# Altium project MONO65_DB_A1_Project.PrjPcb
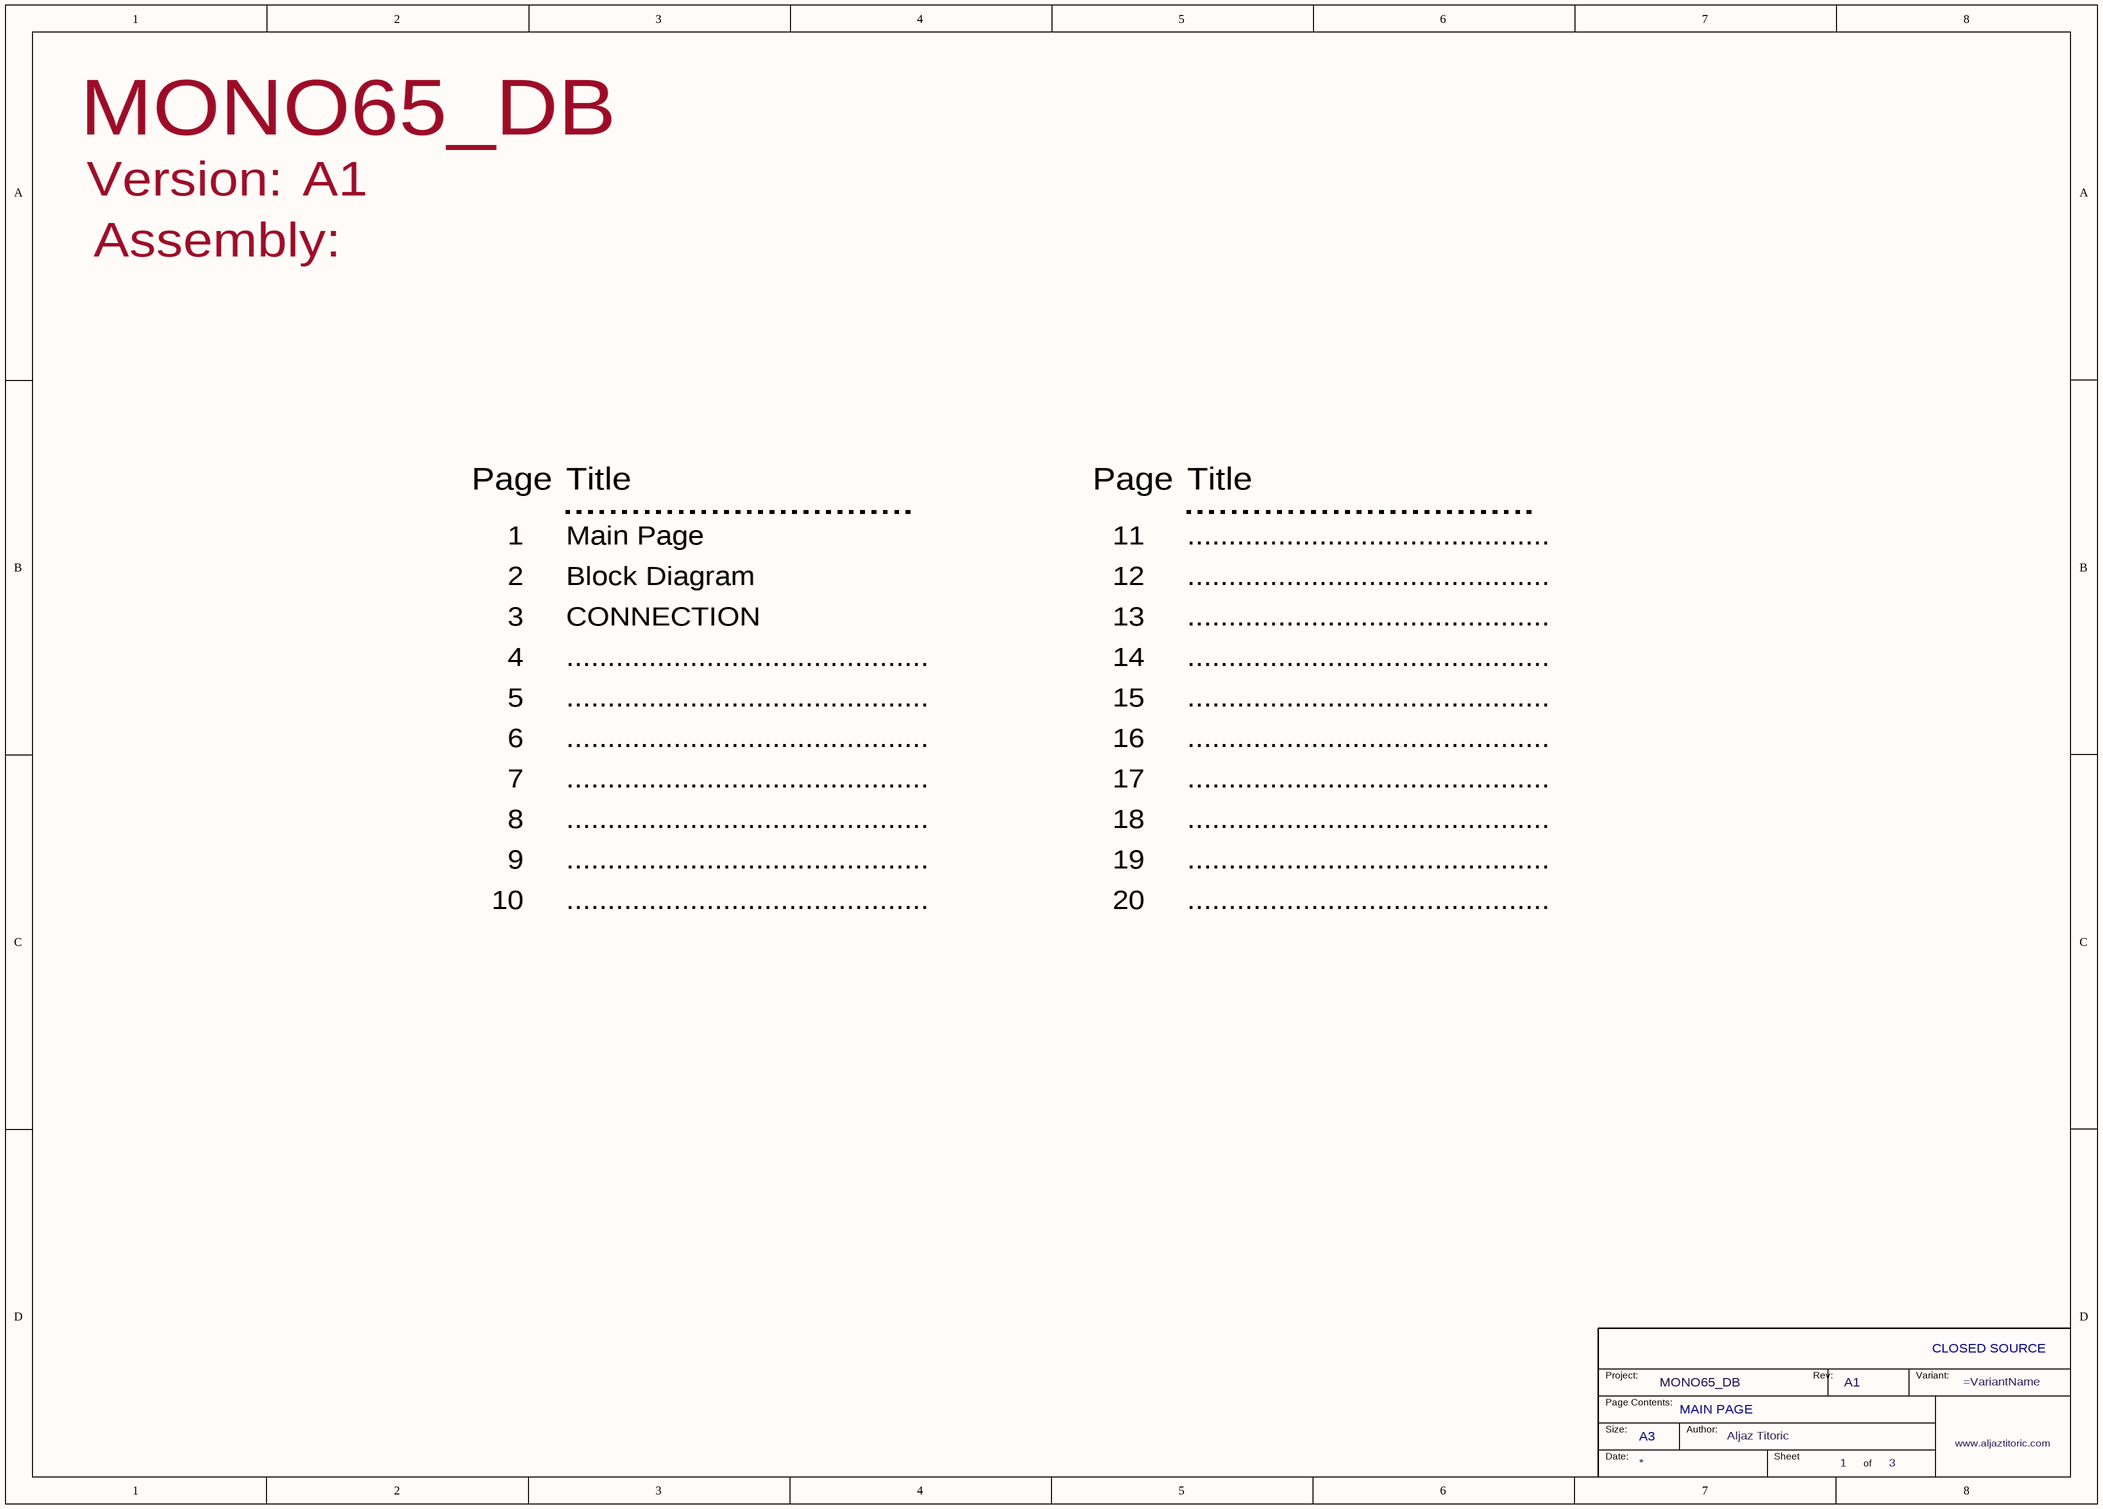
[diagram p0: MONO65_DB_A1_s01 [Main page].SchDoc]
DesignedBy: Aljaz Titoric; DesignedByURL: www.aljaztitoric.com; Project: MONO65_DB; VersionRevision: A1
3 sheets, 15 parts. Net scope: global (net labels, ports and power ports of the same name join across sheets).
Board file: MONO65_DB_A1.PcbDoc
Sheets:
  MONO65_DB_A1_s01 [Main page].SchDoc
  MONO65_DB_A1_s02 [Block diagram].SchDoc
  MONO65_DB_A1_s03 [Connection].SchDoc

## Sheet MONO65_DB_A1_s01 [Main page].SchDoc
size A3; DocumentNumber: 1; SheetNumber: 1; SheetTotal: 3

### Parts
TB*  PageContents: MAIN PAGE  Licence: CLOSED SOURCE  Size: A3  (hidden comment: TBL TitleBlock 01)  (graphical)

### Notes on the sheet
- Version:
- Assembly:
- Page
- Title
- 1
- 2
- Main Page
- Block Diagram
- 11
- 12
- ............................................
- 3
- CONNECTION
- 13
- 4
- 5
- 14
- 15
- 6
- 16
- 7
- 8
- 17
- 18
- 9
- 10
- 19
- 20
- (in symbol TBL TitleBlock 01) Project:; Rev:; Variant:; Page Contents:; Size:; Author:; Date:; Sheet; of

### Library data of the parts
TB* = TBL TitleBlock 01: Custom Title block

## Sheet MONO65_DB_A1_s02 [Block diagram].SchDoc
size A3; DocumentNumber: 2; SheetNumber: 2; SheetTotal: 3
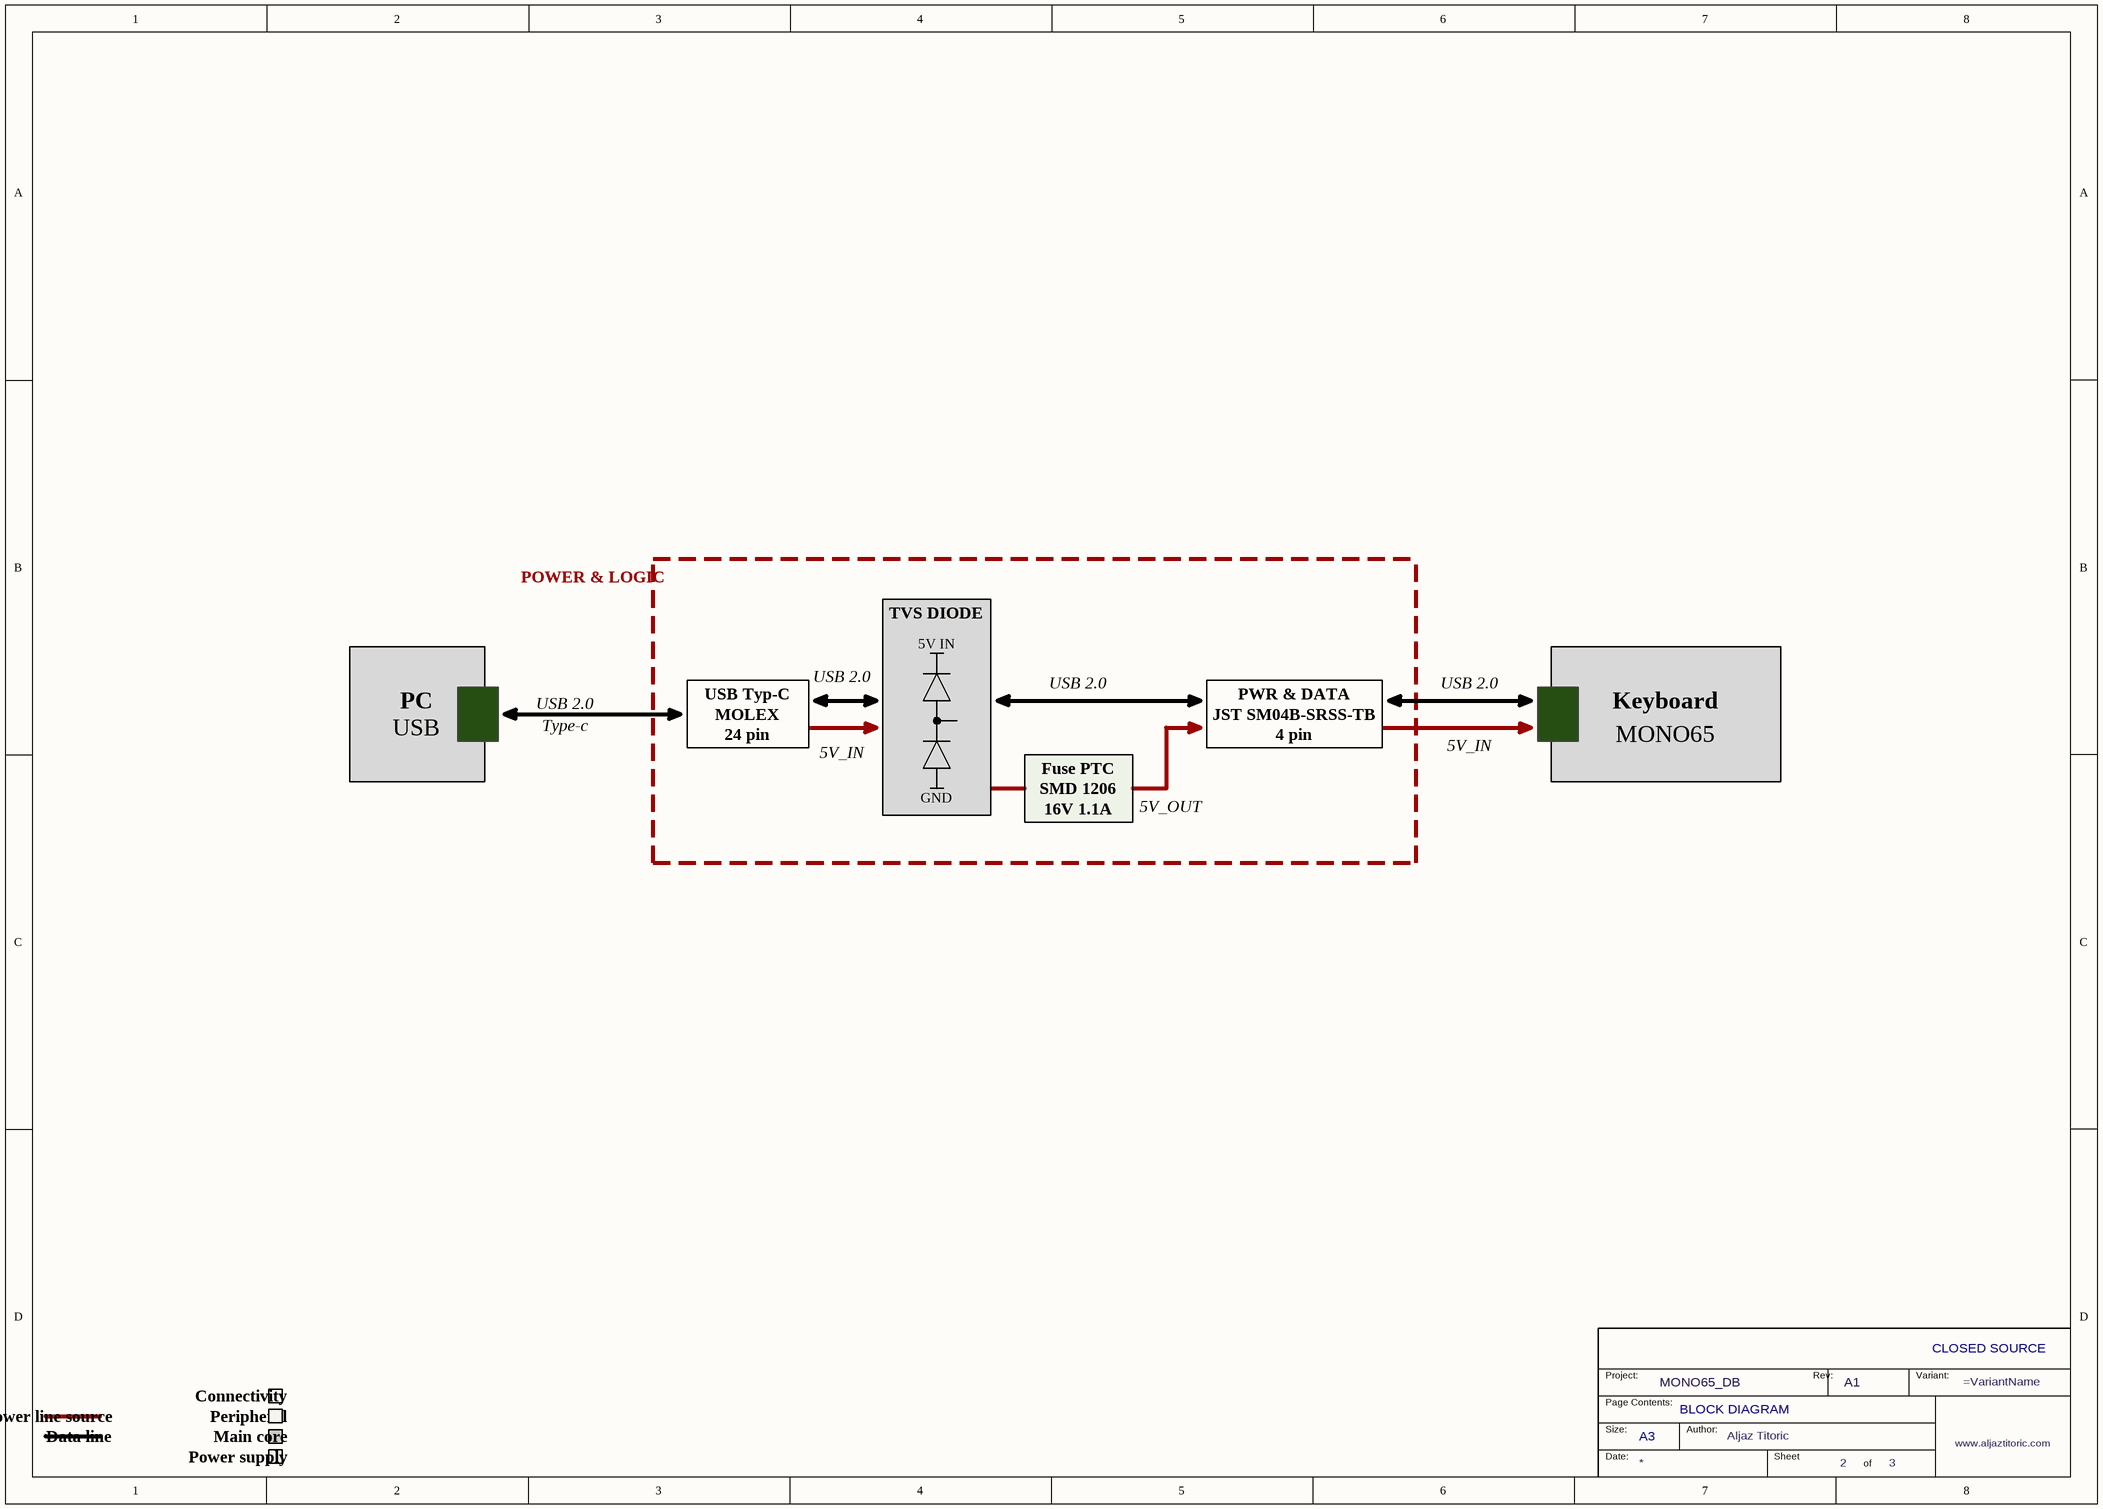
[diagram p1: MONO65_DB_A1_s02 [Block diagram].SchDoc]

### Parts
(Parts that share a designator on the sheet are numbered #1, #2 ... from top to bottom, then left to right.)
TB*?#1  PageContents: BLOCK DIAGRAM  Licence: CLOSED SOURCE  Size: A3  (hidden comment: TBL TitleBlock 01)  (graphical)

### Notes on the sheet
- POWER & LOGIC
- TVS DIODE
- 5V IN
- PC
- USB
- USB 2.0
- Type-c
- MOLEX
- USB Typ-C
- JST SM04B-SRSS-TB
- PWR & DATA
- Keyboard
- 24 pin
- 5V_IN
- GND
- Fuse PTC
- SMD 1206
- 4 pin
- MONO65
- 16V 1.1A
- 5V_OUT
- Connectivity
- Data line
- Power line source
- Peripheral
- Main core
- Power supply
- (in symbol TBL TitleBlock 01) Project:; Rev:; Variant:; Page Contents:; Size:; Author:; Date:; Sheet; of

### Library data of the parts
TB*?#1 = TBL TitleBlock 01: Custom Title block

## Sheet MONO65_DB_A1_s03 [Connection].SchDoc
size A3; DocumentNumber: 3; SheetNumber: 3; SheetTotal: 3
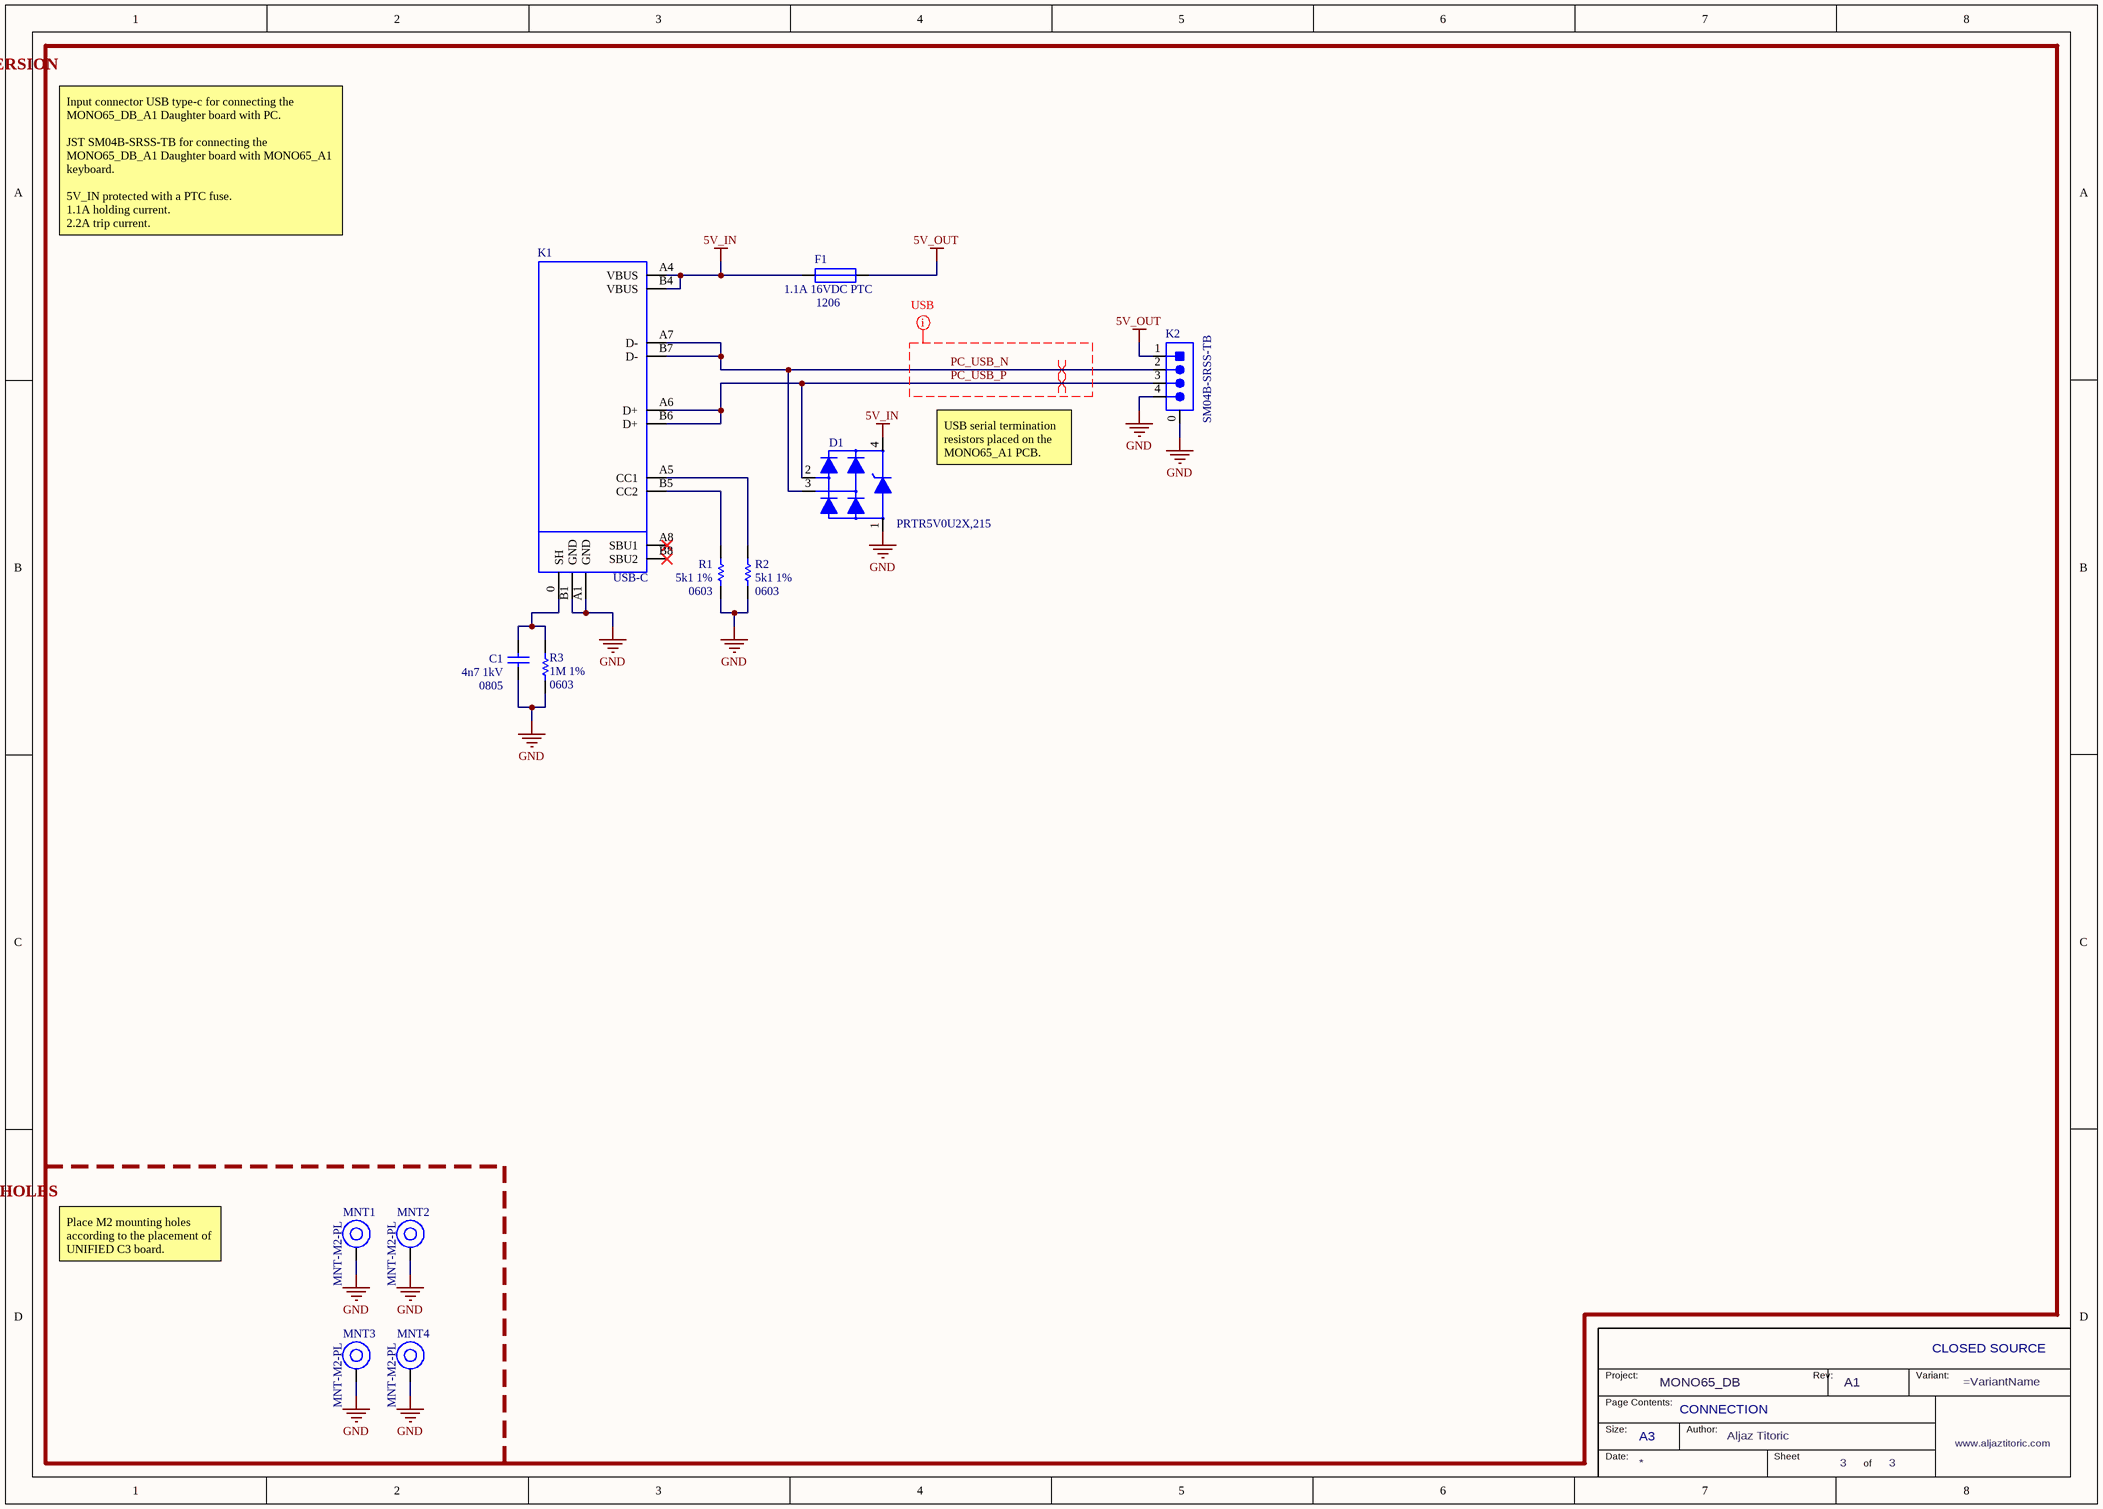
[diagram p2: MONO65_DB_A1_s03 [Connection].SchDoc]

### Parts
(Parts that share a designator on the sheet are numbered #1, #2 ... from top to bottom, then left to right.)
C1  4n7 1kV  Case/Package: 0805  [CAPC2012X12N]
D1  PRTR5V0U2X,215  [SOT143B290X130-4N]
F1  1.1A 16VDC PTC  Case/Package: 1206  [PTC3116X06N]
K1  USB-C  [USB-TYP-C-2.0-217179-0001]
K2  SM04B-SRSS-TB  [SM04B-SRSS-TB]
MNT1  MNT-M2-PL  [MNT-M2-PL]  (no BOM)
MNT2  MNT-M2-PL  [MNT-M2-PL]  (no BOM)
MNT3  MNT-M2-PL  [MNT-M2-PL]  (no BOM)
MNT4  MNT-M2-PL  [MNT-M2-PL]  (no BOM)
R1  5k1 1%  Case/Package: 0603  [RESC1608X04N]
R2  5k1 1%  Case/Package: 0603  [RESC1608X04N]
R3  1M 1%  Case/Package: 0603  [RESC1608X04N]
TB*?#2  PageContents: CONNECTION  Licence: CLOSED SOURCE  Size: A3  (hidden comment: TBL TitleBlock 01)  (graphical)

### Nets
5V_IN: D1.4(VCC) F1.1 K1.A4(VBUS) K1.B4(VBUS)
5V_OUT: F1.2 K2.1
GND: C1.2 D1.1(GND) K1.A1(GND) K1.B1(GND) K2.0 K2.4 MNT1.1 MNT2.1 MNT3.1 MNT4.1 R1.2 R2.2 R3.2
PC_USB_N: D1.3(I/O_2) K1.A7(D-) K1.B7(D-) K2.2
PC_USB_P: D1.2(I/O_1) K1.A6(D+) K1.B6(D+) K2.3
NetC1_1: C1.1 K1.0(SH) R3.1
NetK1_A5: K1.A5(CC1) R2.1
NetK1_B5: K1.B5(CC2) R1.1

Not connected (* = marked no-connect by the designer): K1 A8(SBU1)* B8(SBU2)*

### Layout directives
differential pair; differential pair class DIFF_90Ohm_USB: PC_USB_N, PC_USB_P
net class USB: PC_USB_N, PC_USB_P

### Notes on the sheet
- USB TO JST CONVERSION
- Input connector USB type-c for connecting the MONO65_DB_A1 Daughter board with PC.
  JST SM04B-SRSS-TB for connecting the MONO65_DB_A1 Daughter board with MONO65_A1 keyboard.
  5V_IN protected with a PTC fuse.
  1.1A holding current.
  2.2A trip current.
- USB serial termination resistors placed on the MONO65_A1 PCB.
- M2 MOUNTING HOLES
- Place M2 mounting holes according to the placement of UNIFIED C3 board.
- (in symbol TBL TitleBlock 01) Project:; Rev:; Variant:; Page Contents:; Size:; Author:; Date:; Sheet; of

### Library data of the parts
C1 = CAP SMD CER 4.7n 1kV X7R 0805: SMD CAPACITOR, 4.7n, 1kV, X7R, 0805; Manufacturer: KEMET; Manufacturer Part Number: C0805C472KDRACTU; Dielectric Material: Ceramic; Voltage Rating (DC): 1.5kV; Tolerance: 10%; Capacitance: 4.7nF; Supplier 1: Farnell; Stock 1: 5000; Pricing 1: 2500 = 0,05000 (EUR); RoHS: Yes; Mount: Surface Mount; Case Code (Imperial): 0805; Case Code (Metric): 2012; Min Operating Temperature: -55°C; Max Operating Temperature: 125°C; Package Quantity: 1; Voltage Rating: 1kV; Packaging: Tape and Reel; Dielectric: X7R; Termination: SMD/SMT; Series: C; Length: 2mm; Width: 1.2mm; Height: 1.25mm; Thickness: 0.055inch; Depth: 1.25mm; RoHS Compliant: Yes; ComponentLink1URL: https://datasheet.ciiva.com/5409/kem-c1010-x7r-hv-smd-5409114.pdf?src-supplier=Mouser; ComponentLink1Description: https://datasheet.ciiva.com/5409/kem-c1010-x7r-hv-smd-5409114.pdf?src-supplier=Mouser; Supplier Part Number 1: 3299100
D1 = SEM TVS 5.5V DUAL SOT143B PRTR5V0U2X,215: TVS ESD DIODE - PRTR5V0U2X - Ultra low capacitance double rail-to-rail ESD protection diode; Manufacturer: Nexperia; Supplier 1: Digi-Key; Manufacturer Part Number: PRTR5V0U2X,215; Stock 1: 430; Pricing 1: 1 = 0,54000, 10 = 0,46100, 100 = 0,34400, 500 = 0,27028, 1000 = 0,20886 (USD); RoHS: Yes; RoHS Compliant: Yes; ComponentLink1URL: http://www.farnell.com/datasheets/109718.pdf?src-supplier=Farnell; ComponentLink1Description: http://www.farnell.com/datasheets/109718.pdf?src-supplier=Farnell; ComponentLink2URL: https://assets.nexperia.com/documents/data-sheet/PRTR5V0U2X.pdf?src-supplier=Digi-Key; ComponentLink2Description: https://assets.nexperia.com/documents/data-sheet/PRTR5V0U2X.pdf?src-supplier=Digi-Key; ComponentLink3URL: http://www.farnell.com/datasheets/109718.pdf?src-supplier=Newark; ComponentLink3Description: http://www.farnell.com/datasheets/109718.pdf?src-supplier=Newark; Case/Package: SOT143B; Supplier Part Number 1: 1727-3884-6-ND
F1 = FUS FUS 1206 16VDC 1.1A PTC 1206L110/16WR: PTC Resettable Fuse 1.1A(hold) 2.2A(trip) 16VDC 100A 0.8W 0.1sek 0.06Ohm SMD 1206; Manufacturer: Littelfuse; Time to Trip: 0.1s; Supplier 1: Digi-Key; Manufacturer Part Number: 1206L110/16WR; Stock 1: 3391; Pricing 1: 1 = 0,97000, 5 = 0,93600, 10 = 0,87600, 50 = 0,72500, 100 = 0,60420, 250 = 0,58908, 500 = 0,49846, 1000 = 0,43804 (USD); RoHS: Yes; Case Code (Metric): 3216; Case Code (Imperial): 1206; Max Current Rating: 100A; Packaging: Tape and Reel; Package Quantity: 3000; Hold Current: 1.1A; Trip Current: 2.2A; ComponentLink1URL: http://www.mouser.com/ds/2/240/Littelfuse_PTC_1206L_Datasheet.pdf-477012.pdf?src-supplier=Mouser; ComponentLink1Description: http://www.mouser.com/ds/2/240/Littelfuse_PTC_1206L_Datasheet.pdf-477012.pdf?src-supplier=Mouser; ComponentLink2URL: http://www.littelfuse.com/~/media/electronics/datasheets/resettable_ptcs/littelfuse_ptc_1206l_datasheet.pdf.pdf?src-supplier=Digi-Key; ComponentLink2Description: http://www.littelfuse.com/~/media/electronics/datasheets/resettable_ptcs/littelfuse_ptc_1206l_datasheet.pdf.pdf?src-supplier=Digi-Key; Supplier Part Number 1: 18-1206L110/16WRCT-ND
K1 = CON B2W HYB 217179-0001: USB2.0 Type-C 24P SMD Right Angle SMD; Manufacturer: Molex; Supplier 1: Avnet; Manufacturer Part Number: 217179-0001; Stock 1: 1200; Pricing 1: 1 = 0,77500, 25 = 0,71100, 100 = 0,62500, 250 = 0,56900, 500 = 0,51100, 1000 = 0,46800 (USD); RoHS: No; Supplier Part Number 1: 35AJ1973
K2 = CON B2W HYB B2B SM04B-SRSS-TB: 4pin PHD 1mm SMD JST - SM04B-SRSS-TB - Pin Header, Wire-to-Board, 1 Rows, 4 Contacts, SR Series; Connector Type: Header,Male Pin; Number of Positions: 4; Voltage Rating: 50V; Gender: Male; Supplier 1: Digi-Key; Manufacturer: JST; Manufacturer Part Number: SM04B-SRSS-TB; Stock 1: 0; RoHS: Yes; Mount: Surface Mount; Housing Material: Nylon; Contact Plating: Tin,Lead; Housing Color: Natural; Contact Material: Copper Alloy; Contact Shape: Square; Insulation Material: Nylon; Insulation Color: Natural; Min Operating Temperature: -25°C; Max Operating Temperature: 85°C; Number of Rows: 1; Packaging: Cut Tape; Termination: Solder; Orientation: Horizontal; Fastening Type: Push,Pull; Insulation Height: 0.114inch; Lead Free: Contains Lead; Flammability Rating: UL94 V-0; REACH SVHC: No SVHC; ComponentLink1URL: https://media.digikey.com/pdf/Data%20Sheets/JST%20PDFs/SR%20Connector.pdf?src-supplier=Digi-Key; ComponentLink1Description: https://media.digikey.com/pdf/Data%20Sheets/JST%20PDFs/SR%20Connector.pdf?src-supplier=Digi-Key; Supplier Part Number 1: 455-1422-1-ND
MNT1-MNT4 = MNH M2 PL: Mounting Hole M2 Plated
R1 R2 = RES SMD 5.1k 1% 0603: SMD RESISTOR 5.1k 1% 0603 0.1W; Manufacturer: Yageo; Manufacturer Part Number: RC0603FR-075K1L; Power Rating: 100mW; Temperature Coefficient: 100ppm/°C; Resistance: 5.1kR; Voltage Rating: 50V; Supplier 1: Farnell; Stock 1: 28699; Pricing 1: 10 = 0,02100, 100 = 0,00900, 500 = 0,00650, 1000 = 0,00400, 2500 = 0,00350, 5000 = 0,00300, 25000 = 0,00290 (EUR); RoHS: Yes; Number of Pins: 2; Case Code (Imperial): 0603; Case Code (Metric): 1608; Size Code: 0603; Min Operating Temperature: -55°C; Max Operating Temperature: 155°C; Tolerance: 1%; Series: RC; Packaging: Tape and Reel; Package Quantity: 1; Termination: SMD/SMT; Resistor Type: Thick Film; Number of Terminations: 2; Max Power Dissipation: 100mW; Voltage Rating (DC): 50V; Features: Moisture Resistant; Resistance Tolerance: 1%; Construction: Rectangular; Length: 0.063inch; Width: 0.031inch; Height: 0.022inch; Depth: 0.8mm; RoHS Compliant: Yes; REACH SVHC: No SVHC; Military Standard: Not; Lead Free: Lead Free; ComponentLink1URL: https://datasheet.ciiva.com/46395/443971-46395016.pdf?src-supplier=Element14; ComponentLink1Description: https://datasheet.ciiva.com/46395/443971-46395016.pdf?src-supplier=Element14; ComponentLink2URL: https://datasheet.ciiva.com/15189/getdatasheetpartid-326732-15189786.pdf?src-supplier=Verical; ComponentLink2Description: https://datasheet.ciiva.com/15189/getdatasheetpartid-326732-15189786.pdf?src-supplier=Verical; ComponentLink3URL: https://datasheet.ciiva.com/2454/pyu-r-int-thick-7-2454045.pdf?src-supplier=Digi-Key; ComponentLink3Description: https://datasheet.ciiva.com/2454/pyu-r-int-thick-7-2454045.pdf?src-supplier=Digi-Key; ComponentLink4URL: https://datasheet.ciiva.com/2454/pyu-r-int-thick-7-2454046.pdf?src-supplier=Digi-Key; ComponentLink4Description: https://datasheet.ciiva.com/2454/pyu-r-int-thick-7-2454046.pdf?src-supplier=Digi-Key; ComponentLink5URL: https://datasheet.ciiva.com/2454/pyu-r-int-thick-7-2454047.pdf?src-supplier=Digi-Key; ComponentLink5Description: https://datasheet.ciiva.com/2454/pyu-r-int-thick-7-2454047.pdf?src-supplier=Digi-Key; Supplier Part Number 1: 3495881
R3 = RES SMD 1M 1% 0603: SMD RESISTOR 1M 1% 0603 0.1W; Manufacturer: Yageo; Manufacturer Part Number: RC0603FR-071ML; Voltage Rating: 75V; Voltage Rating (DC): 50V; Resistance: 1MR; Power Rating: 100mW; Temperature Coefficient: 100ppm/°C; Application(s): HIGH RELIABILITY; Supplier 1: Digi-Key; Stock 1: 4592219; Pricing 1: 1 = 0,10000, 10 = 0,02400, 100 = 0,00970, 1000 = 0,00436, 2500 = 0,00378 (USD); RoHS: Yes; Number of Pins: 2; Case Code (Imperial): 0603; Case Code (Metric): 1608; Weight: 0.000847oz; Min Operating Temperature: -55°C; Max Operating Temperature: 155°C; Tolerance: 1%; Packaging: Cut Tape; Package Quantity: 5000; Termination: SMD/SMT; Resistor Type: Thick Film; Type: General Purpose; Series: RC; Technology: THICK FILM; Length: 1.6mm; Width: 0.8mm; Height: 0.45mm; Depth: 0.8mm; RoHS Compliant: Yes; REACH SVHC: No SVHC; Military Standard: Not; Lead Free: Lead Free; ComponentLink1URL: https://datasheet.ciiva.com/11819/0900766b80f96399-11819295.pdf?src-supplier=RSComponents; ComponentLink1Description: https://datasheet.ciiva.com/11819/0900766b80f96399-11819295.pdf?src-supplier=RSComponents; ComponentLink2URL: https://datasheet.ciiva.com/7983/443971-7983614.pdf?src-supplier=Element14; ComponentLink2Description: https://datasheet.ciiva.com/7983/443971-7983614.pdf?src-supplier=Element14; ComponentLink3URL: https://datasheet.ciiva.com/12555/rc0603-272842-12555388.pdf?src-supplier=Mouser; ComponentLink3Description: https://datasheet.ciiva.com/12555/rc0603-272842-12555388.pdf?src-supplier=Mouser; Supplier Part Number 1: 311-1.00MHRCT-ND
TB*?#2 = TBL TitleBlock 01: Custom Title block

## Assembly variants
FULL_Var_SCH: not fitted K7 R8